# Altium schematic sheet USB_Section.SchDoc
size A4; DocumentNumber: 8; SheetNumber: 8; SheetTotal: 8
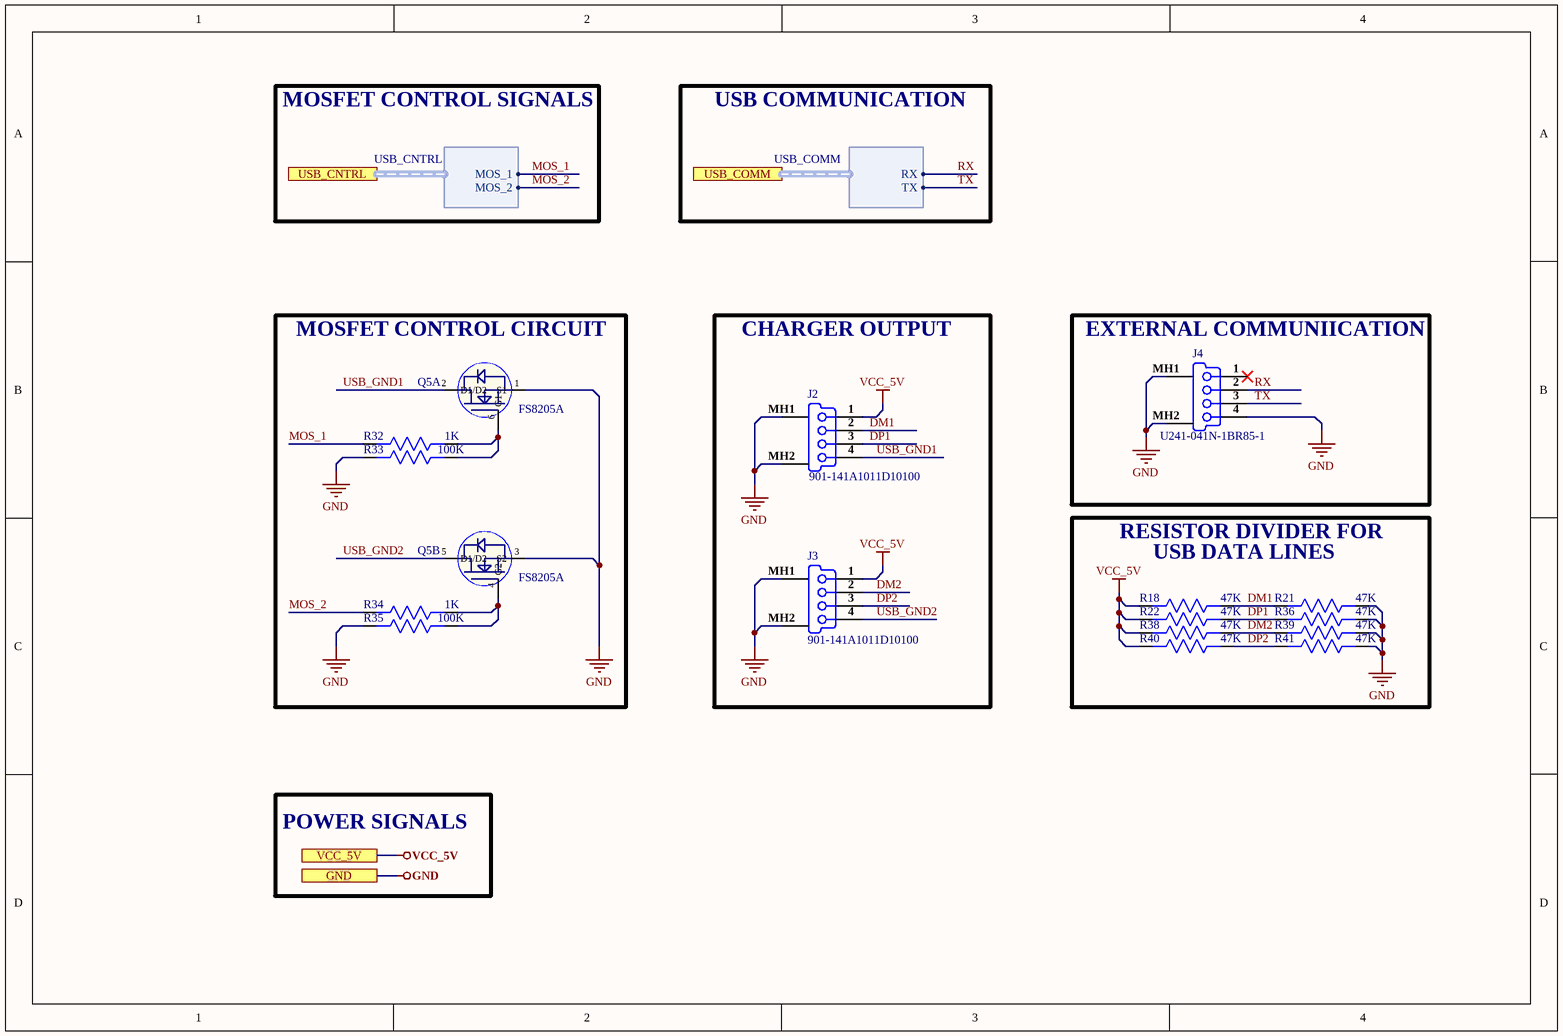
[diagram p0: USB_Section.SchDoc]

## Parts
J2  901-141A1011D10100  [901-141A1011D10100]
J3  901-141A1011D10100  [901-141A1011D10100]
J4  U241-041N-1BR85-1  [U241-041N-1BR85-1]
Q5  FS8205A  [SOT-23-6]  (parts A,B of 2)
R18  47K  [Res0603]
R21  47K  [Res0603]
R22  47K  [Res0603]
R32  1K  [Res0603]
R33  100K  [Res0603]
R34  1K  [Res0603]
R35  100K  [Res0603]
R36  47K  [Res0603]
R38  47K  [Res0603]
R39  47K  [Res0603]
R40  47K  [Res0603]
R41  47K  [Res0603]

## Blocks framed on the sheet
MOSFET CONTROL CIRCUIT: Q5 R32-R35
CHARGER OUTPUT: J2 J3
EXTERNAL COMMUNIICATION: J4

## Ports
GND, USB_CNTRL (harness USB_CNTRL), USB_COMM (harness USB_COMM), VCC_5V

## Harnesses
USB_CNTRL: MOS_1, MOS_2
USB_COMM: RX, TX

## Nets
GND: J2.MH1(Tab) J2.MH2(Tab) J3.MH1(Tab) J3.MH2(Tab) J4.4(GND) J4.MH1(Tab) J4.MH2(Tab) Q5.1(S1) Q5.3(S2) R21.1 R33.2 R35.2 R36.1 R39.1 R41.1 ; port GND
VCC_5V: J2.1(V_BUS_(5V)) J3.1(V_BUS_(5V)) R18.2 R22.2 R38.2 R40.2 ; port VCC_5V
DM1: J2.2(D-) R18.1 R21.2
DM2: J3.2(D-) R38.1 R39.2
DP1: J2.3(D+) R22.1 R36.2
DP2: J3.3(D+) R40.1 R41.2
MOS_1: R32.2 ; port USB_CNTRL.MOS_1
MOS_2: R34.2 ; port USB_CNTRL.MOS_2
RX: J4.2(D-) ; port USB_COMM.RX
TX: J4.3(D+) ; port USB_COMM.TX
USB_GND1: J2.4(GND) Q5.2(D1/D2)
USB_GND2: J3.4(GND) Q5.5(D1/D2)
NetQ5_4: Q5.4(G2) R34.1 R35.1
NetQ5_6: Q5.6(G1) R32.1 R33.1

Not connected (* = marked no-connect by the designer): J4 1(V_BUS_(5V))*

## Notes on the sheet
- MOSFET CONTROL SIGNALS
- USB COMMUNICATION
- RESISTOR DIVIDER FOR
- USB DATA LINES
- POWER SIGNALS

## Library data of the parts
J2 J3 = 901-141A1011D10100: USB - Type A 4 USB 2.0 Female THT; Manufacturer: Jing Extension of the Electronic Co.; Current Rating: 1.5A; Number of Ports: 1; Number of Contacts: 4; Mounting Type: ThroughHole，RightAngle; Connector Type: USB - Type A; Standard: USB 2.0; Gender: Female
J4 = U241-041N-1BR85-1: USB - Type B 4 USB 2.0 Female Through Hole; Manufacturer: XKB Connectivity; Current Rating: 2A; Number of Ports: 1; Number of Contacts: 4; Mounting Type: ThroughHole，RightAngle; Connector Type: USB - Type B; Standard: USB 2.0; Gender: Female
Q5 = FS8205A: 2 N-Channel 466pF 10V 5.7nC 10V +150℃ (Tj) SOT23-6 MOSFETs; Manufacturer: TECH; Value: Custom; Manufacturer Part No: FS8205A; Package: SOT23-6; ComponentLink1Description: LCSC; ComponentLink1URL: https://lcsc.com/product-detail/MOSFETs_TECH-PUBLIC-FS8205A_C2830320.html
R18 R21 R22 R36 R38-R41 = ERJP03F4702V: RES SMD 47K Ohm 1% 0.2W(1/5W) 0603; Manufacturer: Panasonic; Manufacturer Part Number: ERJ-P03F4702V; Resistance: 47kR; Temperature Coefficient: 200ppm/°C; Power Rating: 200mW; Voltage Rating: 150V; Supplier 1: Digi-Key; RoHS: Yes; Category: Chip SMD Resistors; Stock 1: 5635; Pricing 1: 1=0.37000, 10=0.31600, 100=0.12360, 1000=0.05175, 2500=0.04744 (USD); Mount: Surface Mount; Case/Package: 0603; Number of Pins: 2; Contact Plating: Tin; Case Code (Imperial): 0603; Case Code (Metric): 1608; Min Operating Temperature: -55°C; Max Operating Temperature: 155°C; Tolerance: 1%; Resistor Type: Thick Film; Packaging: Tape and Reel; Package Quantity: 5000; Termination: SMD/SMT; Voltage Rating (DC): 150V; Length: 1.6mm; Width: 0.8mm; Height: 0.45mm; Depth: 0.8mm; Radiation Hardening: No; REACH SVHC: No SVHC; Military Standard: Not; RoHS Compliant: Yes; ComponentLink1URL: https://datasheet.ciiva.com/11817/0900766b812cb812-11817157.pdf?src-supplier=RSComponents; ComponentLink1Description: https://datasheet.ciiva.com/11817/0900766b812cb812-11817157.pdf?src-supplier=RSComponents; ComponentLink2URL: https://datasheet.ciiva.com/48537/erjp-series-eng-tds-48537294.pdf?src-supplier=Distrelec; ComponentLink2Description: https://datasheet.ciiva.com/48537/erjp-series-eng-tds-48537294.pdf?src-supplier=Distrelec; ComponentLink3URL: https://datasheet.ciiva.com/6138/1801181-6138332.pdf?src-supplier=Farnell; ComponentLink3Description: https://datasheet.ciiva.com/6138/1801181-6138332.pdf?src-supplier=Farnell; ComponentLink4URL: https://datasheet.ciiva.com/7802/1790600-7802523.pdf?src-supplier=Element14; ComponentLink4Description: https://datasheet.ciiva.com/7802/1790600-7802523.pdf?src-supplier=Element14; ComponentLink5URL: https://datasheet.ciiva.com/7802/1790600-7802522.pdf?src-supplier=Element14; ComponentLink5Description: https://datasheet.ciiva.com/7802/1790600-7802522.pdf?src-supplier=Element14; ComponentLink6URL: https://datasheet.ciiva.com/22730/1790600-22730106.pdf?src-supplier=Element14; ComponentLink6Description: https://datasheet.ciiva.com/22730/1790600-22730106.pdf?src-supplier=Element14; ComponentLink7URL: https://datasheet.ciiva.com/28681/1790600-28681575.pdf?src-supplier=Element14; ComponentLink7Description: https://datasheet.ciiva.com/28681/1790600-28681575.pdf?src-supplier=Element14; ComponentLink8URL: https://datasheet.ciiva.com/24072/aoa0000ce4-64075-24072175.pdf?src-supplier=Mouser; ComponentLink8Description: https://datasheet.ciiva.com/24072/aoa0000ce4-64075-24072175.pdf?src-supplier=Mouser; Supplier Part Number 1: P16027CT-ND
R32 R34 = RC0603FR-071KL: RES SMD 1K OHM 1% 1/10W 0603; Manufacturer: Yageo; Resistance: 1kR; Temperature Coefficient: 100ppm/°C; Power Rating: 100mW; Voltage Rating: 50V; ComponentLink1URL: https://www.verical.com/server-webapp/html/getDatasheet?partID=409289&src-supplier=Verical; ComponentLink1Description: https://www.verical.com/server-webapp/html/getDatasheet?partID=409289&src-supplier=Verical; Supplier 1: Digi-Key; Manufacturer Part Number: RC0603FR-071KL; Stock 1: 21472395; Pricing 1: 1=0.1, 10=0.023, 100=0.0094, 1000=0.0042, 2500=0.0037 (USD); Case/Package: 0603; Contact Plating: Tin,Matte; Case Code (Imperial): 0603; Case Code (Metric): 1608; Min Operating Temperature: -55°C; Max Operating Temperature: 155°C; Tolerance: 1%; Composition: Thick Film; Packaging: Tape and Reel; Termination: SMD/SMT; Military Standard: Not; Length: 1.6mm; Height: 0.45mm; Depth: 0.8mm; Radiation Hardening: No; REACH SVHC: No SVHC; Lead Free: Lead Free; ComponentLink2URL: http://documents.rs-components.com/techlib://itc_doclist_GB.htm?stockno=5048928&src-supplier=RSComponents; ComponentLink2Description: http://documents.rs-components.com/techlib://itc_doclist_GB.htm?stockno=5048928&src-supplier=RSComponents; ComponentLink3URL: http://www.yageo.com/documents/recent/PYu-RC0603_51_RoHS_L_4.pdf?src-supplier=Avnet+Europe; ComponentLink3Description: http://www.yageo.com/documents/recent/PYu-RC0603_51_RoHS_L_4.pdf?src-supplier=Avnet+Europe; ComponentLink4URL: http://www.farnell.com/datasheets/2167052.pdf?src-supplier=Element14; ComponentLink4Description: http://www.farnell.com/datasheets/2167052.pdf?src-supplier=Element14; ComponentLink5URL: http://www.farnell.com/datasheets/1868787.pdf?src-supplier=Element14; ComponentLink5Description: http://www.farnell.com/datasheets/1868787.pdf?src-supplier=Element14; ComponentLink6URL: http://www.yageo.com/documents/recent/PYu-RC_Group_51_RoHS_L_2.pdf?src-supplier=Avnet; ComponentLink6Description: http://www.yageo.com/documents/recent/PYu-RC_Group_51_RoHS_L_2.pdf?src-supplier=Avnet; ComponentLink7URL: https://www.verical.com/server-webapp/html/getDatasheet?partID=404327&src-supplier=Verical; ComponentLink7Description: https://www.verical.com/server-webapp/html/getDatasheet?partID=404327&src-supplier=Verical; ComponentLink8URL: http://www.farnell.com/datasheets/443971.pdf?src-supplier=Element14; ComponentLink8Description: http://www.farnell.com/datasheets/443971.pdf?src-supplier=Element14; Supplier Part Number 1: 311-1.00KHRDKR-ND
R33 R35 = RC0603FR-07100KL: RES SMD 100K OHM 1% 1/10W 0603